# Altium schematic sheet TYPE-C_TO_MIPI-CSI_SHEET.SchDoc
size 420 x 297 mm; SheetNumber: 20; SheetTotal: 23
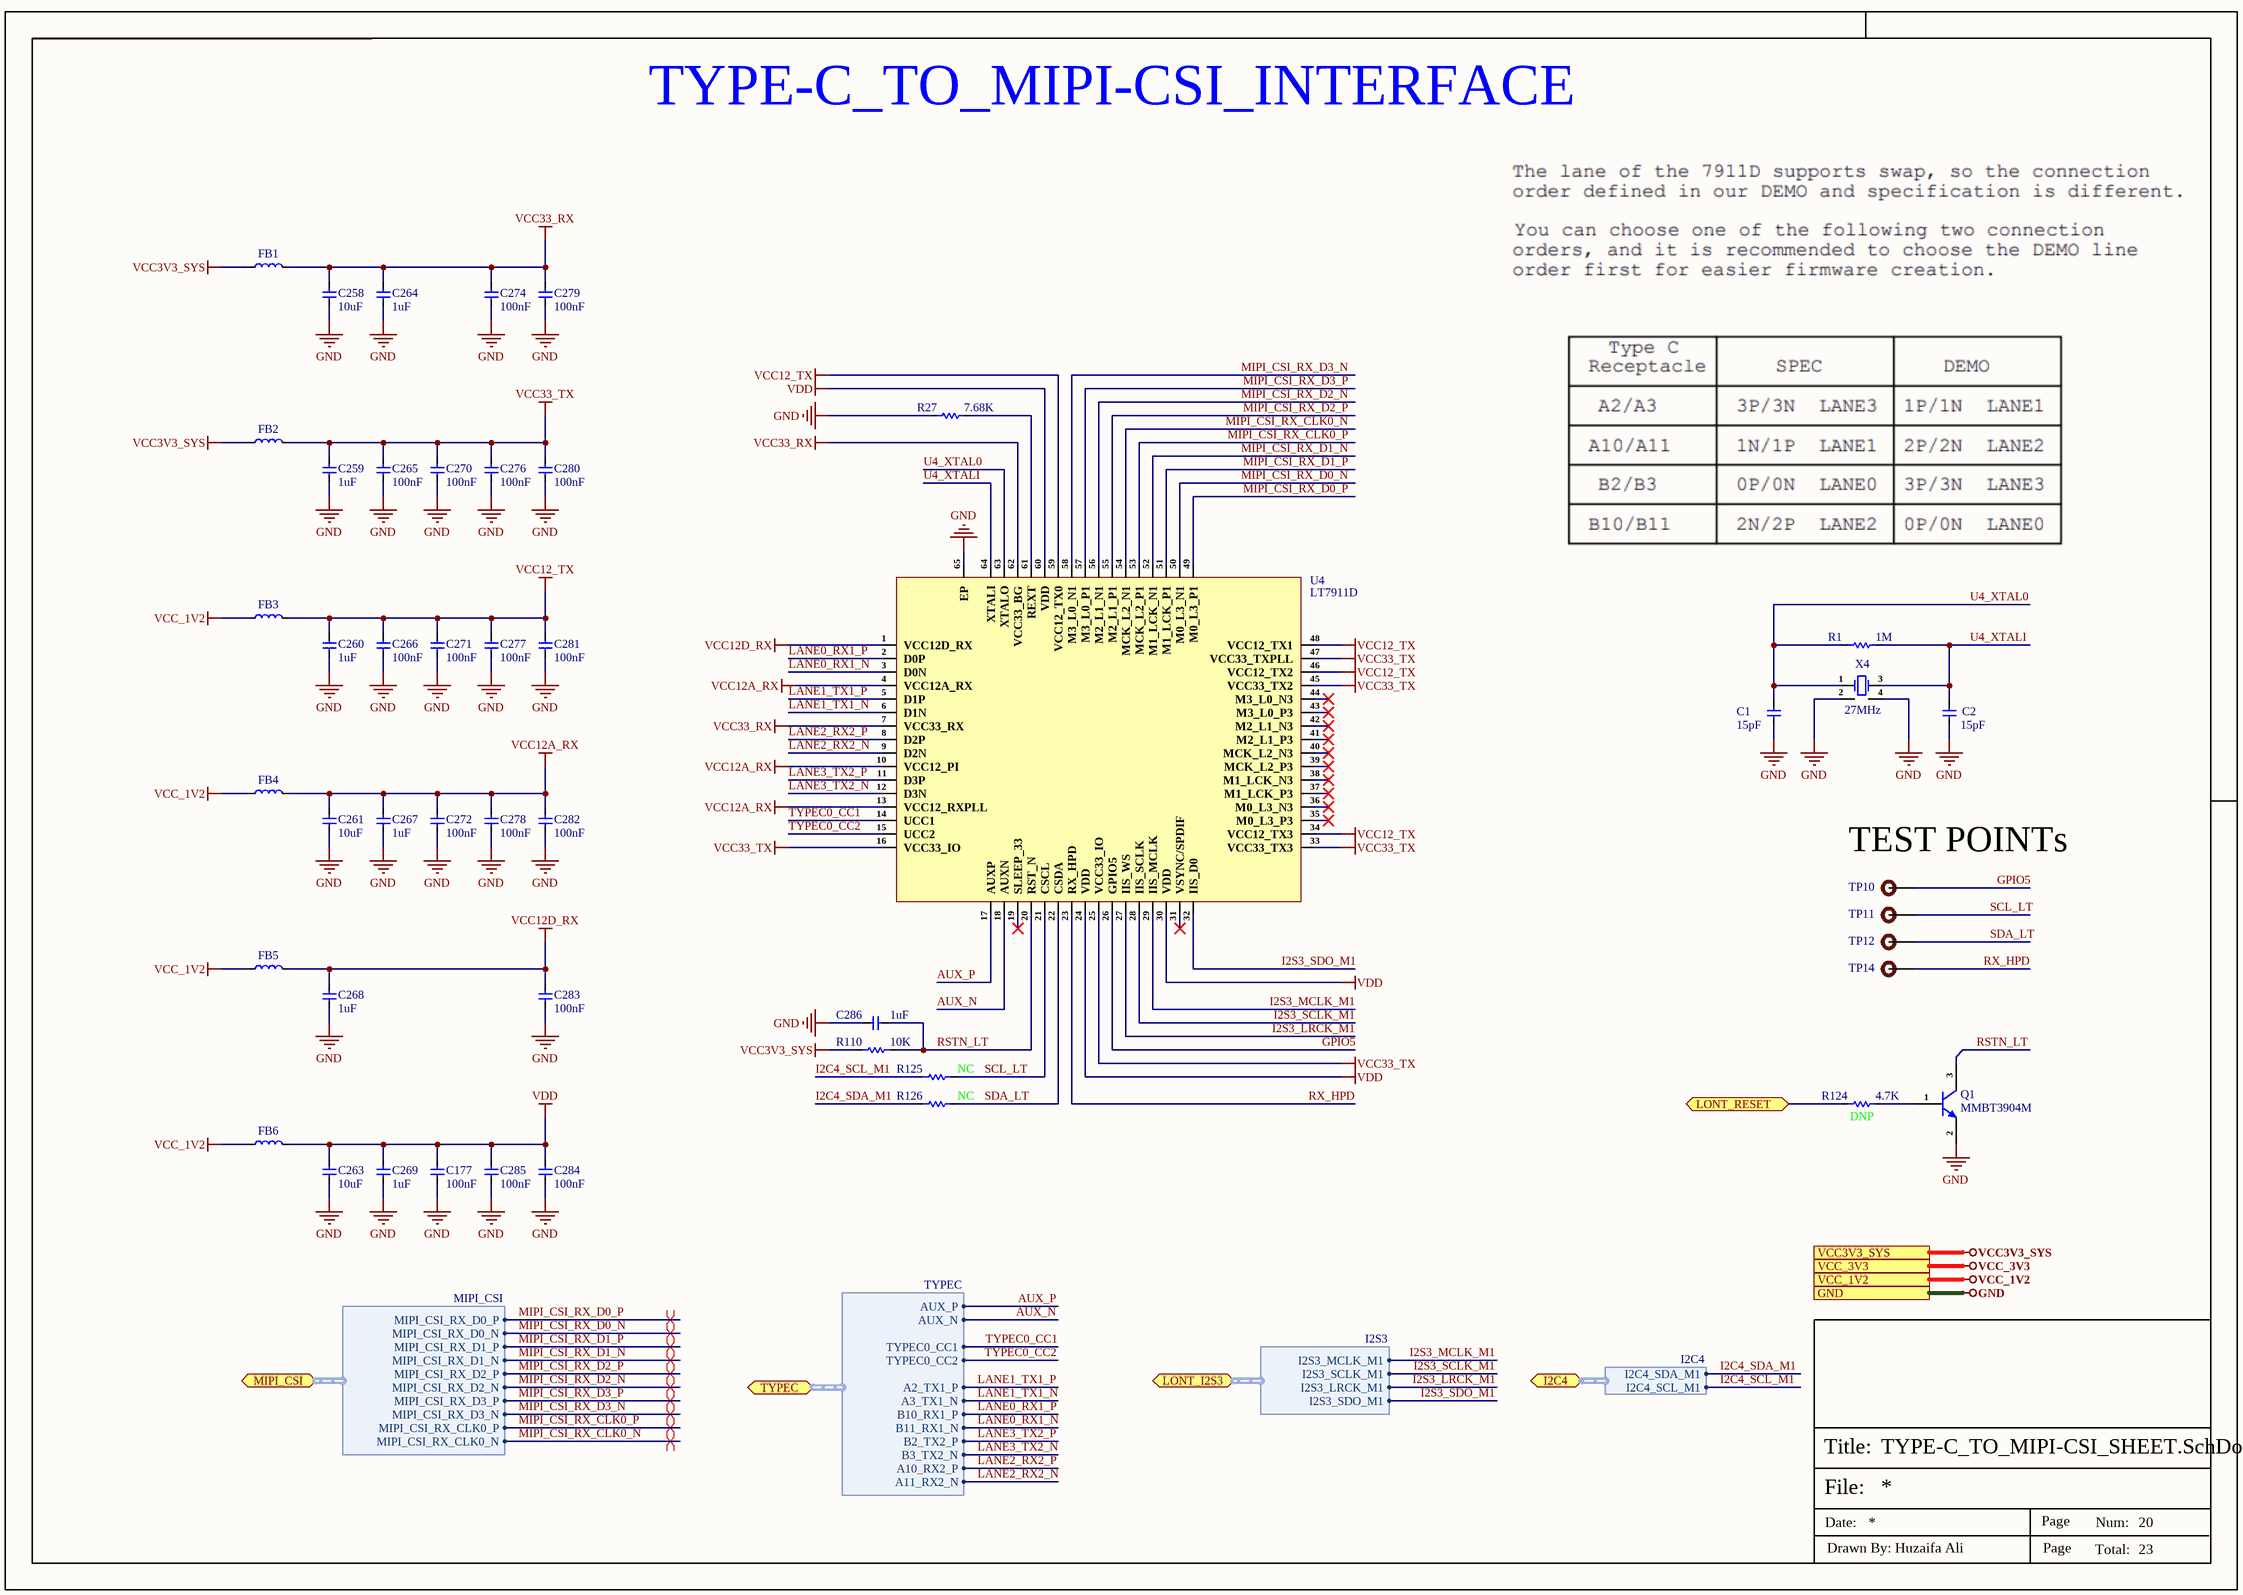
[diagram p0: TYPE-C_TO_MIPI-CSI_SHEET.SchDoc]

## Parts
C1  15pF  [Cap-0402]
C2  15pF  [Cap-0402]
C177  100nF  [CAP-0201]
C258  10uF  [Cap-0402]
C259  1uF  [Cap-0402]
C260  1uF  [Cap-0402]
C261  10uF  [Cap-0402]
C263  10uF  [Cap-0402]
C264  1uF  [Cap-0402]
C265  100nF  [CAP-0201]
C266  100nF  [CAP-0201]
C267  1uF  [Cap-0402]
C268  1uF  [CAP-0201]
C269  1uF  [CAP-0201]
C270  100nF  [CAP-0201]
C271  100nF  [CAP-0201]
C272  100nF  [CAP-0201]
C274  100nF  [CAP-0201]
C276  100nF  [CAP-0201]
C277  100nF  [CAP-0201]
C278  100nF  [CAP-0201]
C279  100nF  [CAP-0201]
C280  100nF  [CAP-0201]
C281  100nF  [CAP-0201]
C282  100nF  [CAP-0201]
C283  100nF  [CAP-0201]
C284  100nF  [CAP-0201]
C285  100nF  [CAP-0201]
C286  1uF  [CAP-0201]
FB1  BLM18SG221TN1D  [IND-0603 (1608 Metric)]  (value not drawn)
FB2  BLM18SG221TN1D  [IND-0603 (1608 Metric)]  (value not drawn)
FB3  BLM18SG221TN1D  [IND-0603 (1608 Metric)]  (value not drawn)
FB4  BLM18SG221TN1D  [IND-0603 (1608 Metric)]  (value not drawn)
FB5  BLM18SG221TN1D  [IND-0603 (1608 Metric)]  (value not drawn)
FB6  BLM18SG221TN1D  [IND-0603 (1608 Metric)]  (value not drawn)
Q1  MMBT3904M  [SOT-723]
R1  1M  [Res-0402]
R27  7.68K  [Res-0402]
R110  10K  [Res-0201]
R124  DNP  [Res-0402]
R125  NC  [Res-0402]
R126  NC  [Res-0402]
TP10  TEST POINT 0.5mm Dia  [Test-point - 0.5mm]  (value not drawn)  (no BOM)
TP11  TEST POINT 0.5mm Dia  [Test-point - 0.5mm]  (value not drawn)  (no BOM)
TP12  TEST POINT 0.5mm Dia  [Test-point - 0.5mm]  (value not drawn)  (no BOM)
TP14  TEST POINT 0.5mm Dia  [Test-point - 0.5mm]  (value not drawn)  (no BOM)
U4  LT7911D  [QFN-64-EP(7.5x7.5)]
X4  27MHz  [SMD2520-4P]

## Ports
GND (see DRAM_LPDDR4_SHEET[6D], eMMC_SPI-FLASH_SHEET[1D], HDMI2.0_SHEET[3D], POWER_LDO_SHEET[3D], POWER_OTHER_SHEET[3C], POWER_PMIC_RK809_CODEC[3C], POWER_PMIC_RK809_DC DC[3D], POWER_PMIC_RK809_LDO[4C], POWER_PMIC_RK809_MGM[3D], RK3566_AUDIO_SHEET[3C], RK3566_DDR-PHY_SHEET[5D], RK3566_FLASH-SD_SHEET[4C], RK3566_OSC_PMUIO_SHEET[5D], RK3566_POWER_SHEET[3D], RK3566_SARADC_GPIO[3D], RK3566_USB_PCIe_SHEET[3D], RK3566_VI_SHEET[3D], RK3566_VO_SHEET_1[3C], RK3566_VO_SHEET_2[4C], TYPE-C_INTERFACE_SHEET[3D], USB2.0_SHEET[3D], WIFI-6_SHEET[3D]), I2C4 (bidir, harness I2C4, see RK3566_VI_SHEET[1D]), LONT_I2S3 (bidir, harness I2S3, see RK3566_AUDIO_SHEET[3B]), LONT_RESET (bidir, see RK3566_VI_SHEET[3B]), MIPI_CSI (bidir, harness MIPI_CSI, see RK3566_VI_SHEET[1D]), TYPEC (bidir, harness TYPEC, see TYPE-C_INTERFACE_SHEET[1D]), VCC3V3_SYS (see DRAM_LPDDR4_SHEET[6D], POWER_LDO_SHEET[3D], POWER_OTHER_SHEET[3C], POWER_PMIC_RK809_DC DC[3D], POWER_PMIC_RK809_LDO[4C], POWER_PMIC_RK809_MGM[3D], RK3566_SARADC_GPIO[3D], WIFI-6_SHEET[3D]), VCC_1V2 (see POWER_OTHER_SHEET[3C]), VCC_3V3 (see eMMC_SPI-FLASH_SHEET[1D], HDMI2.0_SHEET[3D], POWER_PMIC_RK809_LDO[4C], RK3566_AUDIO_SHEET[3C], RK3566_SARADC_GPIO[3D], RK3566_USB_PCIe_SHEET[3D], RK3566_VI_SHEET[3D], RK3566_VO_SHEET_2[4C], WIFI-6_SHEET[3D])

## Harnesses
MIPI_CSI: MIPI_CSI_RX_D0_P, MIPI_CSI_RX_D0_N, MIPI_CSI_RX_D1_P, MIPI_CSI_RX_D1_N, MIPI_CSI_RX_D2_P, MIPI_CSI_RX_D2_N, MIPI_CSI_RX_D3_P, MIPI_CSI_RX_D3_N, MIPI_CSI_RX_CLK0_P, MIPI_CSI_RX_CLK0_N
TYPEC: TYPEC0_CC1, TYPEC0_CC2, AUX_N, AUX_P, A2_TX1_P, A3_TX1_N, B11_RX1_N, B10_RX1_P, B3_TX2_N, B2_TX2_P, A10_RX2_P, A11_RX2_N
I2S3: I2S3_MCLK_M1, I2S3_SCLK_M1, I2S3_LRCK_M1, I2S3_SDO_M1
I2C4: I2C4_SDA_M1, I2C4_SCL_M1

## Nets
GND: C1.1 C2.1 C177.1 C258.1 C259.1 C260.1 C261.1 C263.1 C264.1 C265.1 C266.1 C267.1 C268.1 C269.1 C270.1 C271.1 C272.1 C274.1 C276.1 C277.1 C278.1 C279.1 C280.1 C281.1 C282.1 C283.1 C284.1 C285.1 C286.1 Q1.2(E) R27.2 U4.65(EP) X4.2(GND) X4.4(GND) ; port GND
VCC3V3_SYS: FB1.1 FB2.1 R110.1 ; port VCC3V3_SYS
VCC12_TX: C260.2 C266.2 C271.2 C277.2 C281.2 FB3.2 U4.34(VCC12_TX3) U4.46(VCC12_TX2) U4.48(VCC12_TX1) U4.59(VCC12_TX0)
VCC12A_RX: C261.2 C267.2 C272.2 C278.2 C282.2 FB4.2 U4.4(VCC12A_RX) U4.10(VCC12_PI) U4.13(VCC12_RXPLL)
VCC12D_RX: C268.2 C283.2 FB5.2 U4.1(VCC12D_RX)
VCC33_RX: C258.2 C264.2 C274.2 C279.2 FB1.2 U4.7(VCC33_RX) U4.62(VCC33_BG)
VCC33_TX: C259.2 C265.2 C270.2 C276.2 C280.2 FB2.2 U4.16(VCC33_IO) U4.25(VCC33_IO) U4.33(VCC33_TX3) U4.45(VCC33_TX2) U4.47(VCC33_TXPLL)
VCC_1V2: FB3.1 FB4.1 FB5.1 FB6.1 ; port VCC_1V2
VCC_3V3: port VCC_3V3
VDD: C177.2 C263.2 C269.2 C284.2 C285.2 FB6.2 U4.24(VDD) U4.30(VDD) U4.60(VDD)
AUX_N: U4.18(AUXN) ; port TYPEC.AUX_N
AUX_P: U4.17(AUXP) ; port TYPEC.AUX_P
GPIO5: TP10.1 U4.26(GPIO5)
I2C4_SCL_M1: R125.1 ; port I2C4.I2C4_SCL_M1
I2C4_SDA_M1: R126.1 ; port I2C4.I2C4_SDA_M1
I2S3_LRCK_M1: U4.27(IIS_WS) ; port LONT_I2S3.I2S3_LRCK_M1
I2S3_MCLK_M1: U4.29(IIS_MCLK) ; port LONT_I2S3.I2S3_MCLK_M1
I2S3_SCLK_M1: U4.28(IIS_SCLK) ; port LONT_I2S3.I2S3_SCLK_M1
I2S3_SDO_M1: U4.32(IIS_D0) ; port LONT_I2S3.I2S3_SDO_M1
LANE0_RX1_N: U4.3(D0N) ; port TYPEC.B11_RX1_N
LANE0_RX1_P: U4.2(D0P) ; port TYPEC.B10_RX1_P
LANE1_TX1_N: U4.6(D1N) ; port TYPEC.A3_TX1_N
LANE1_TX1_P: U4.5(D1P) ; port TYPEC.A2_TX1_P
LANE2_RX2_N: U4.9(D2N) ; port TYPEC.A11_RX2_N
LANE2_RX2_P: U4.8(D2P) ; port TYPEC.A10_RX2_P
LANE3_TX2_N: U4.12(D3N) ; port TYPEC.B3_TX2_N
LANE3_TX2_P: U4.11(D3P) ; port TYPEC.B2_TX2_P
LONT_RESET: R124.1 ; port LONT_RESET
MIPI_CSI_RX_CLK0_N: U4.54(MCK_L2_N1) ; port MIPI_CSI.MIPI_CSI_RX_CLK0_N
MIPI_CSI_RX_CLK0_P: U4.53(MCK_L2_P1) ; port MIPI_CSI.MIPI_CSI_RX_CLK0_P
MIPI_CSI_RX_D0_N: U4.50(M0_L3_N1) ; port MIPI_CSI.MIPI_CSI_RX_D0_N
MIPI_CSI_RX_D0_P: U4.49(M0_L3_P1) ; port MIPI_CSI.MIPI_CSI_RX_D0_P
MIPI_CSI_RX_D1_N: U4.52(M1_LCK_N1) ; port MIPI_CSI.MIPI_CSI_RX_D1_N
MIPI_CSI_RX_D1_P: U4.51(M1_LCK_P1) ; port MIPI_CSI.MIPI_CSI_RX_D1_P
MIPI_CSI_RX_D2_N: U4.56(M2_L1_N1) ; port MIPI_CSI.MIPI_CSI_RX_D2_N
MIPI_CSI_RX_D2_P: U4.55(M2_L1_P1) ; port MIPI_CSI.MIPI_CSI_RX_D2_P
MIPI_CSI_RX_D3_N: U4.58(M3_L0_N1) ; port MIPI_CSI.MIPI_CSI_RX_D3_N
MIPI_CSI_RX_D3_P: U4.57(M3_L0_P1) ; port MIPI_CSI.MIPI_CSI_RX_D3_P
RSTN_LT: C286.2 Q1.3(C) R110.2 U4.20(RST_N)
RX_HPD: TP14.1 U4.23(RX_HPD)
SCL_LT: R125.2 TP11.1 U4.21(CSCL)
SDA_LT: R126.2 TP12.1 U4.22(CSDA)
TYPEC0_CC1: U4.14(UCC1) ; port TYPEC.TYPEC0_CC1
TYPEC0_CC2: U4.15(UCC2) ; port TYPEC.TYPEC0_CC2
U4_XTAL0: C1.2 R1.1 U4.63(XTALO) X4.1(OSC1)
U4_XTALI: C2.2 R1.2 U4.64(XTALI) X4.3(OSC2)
NetQ1_1: Q1.1(B) R124.2
NetR27_1: R27.1 U4.61(REXT)

Not connected (* = marked no-connect by the designer): U4 19(SLEEP_33)* 31(VSYNC/SPDIF)* 35(M0_L3_P3)* 36(M0_L3_N3)* 37(M1_LCK_P3)* 38(M1_LCK_N3)* 39(MCK_L2_P3)* 40(MCK_L2_N3)* 41(M2_L1_P3)* 42(M2_L1_N3)* 43(M3_L0_P3)* 44(M3_L0_N3)*

## Layout directives
differential pair; differential pair class MIPI_LINES_100; rule Matched Net Lengths [Tolerance = 0.508mm]; rule Impedance Constraint [Min = 98.00    Max = 102.0    ]: MIPI_CSI_RX_CLK0_N, MIPI_CSI_RX_CLK0_P, MIPI_CSI_RX_D0_N, MIPI_CSI_RX_D0_P, MIPI_CSI_RX_D1_N, MIPI_CSI_RX_D1_P, MIPI_CSI_RX_D2_N, MIPI_CSI_RX_D2_P, MIPI_CSI_RX_D3_N, MIPI_CSI_RX_D3_P

## Notes on the sheet
- TYPE-C_TO_MIPI-CSI_INTERFACE
- (near TP10) TEST POINTs
- (near R124) 4.7K
- File:
- Title:
- Date:
- Page
- Num:
- Total:
- Drawn By: Huzaifa Ali

## Library data of the parts
C1 C2 = CQ0402GRNPO9BN150: CAP CER 15PF 50V C0G/NPO 0402; Manufacturer: Yageo; Tolerance: 2%; Dielectric: C0G; Item Type: Capacitors; Manufacturer Part Number: CQ0402GRNPO9BN150; RoHS: Yes; Mounting Technology: Surface Mount; Case/Package: 0402; Case Code (Metric): 1005; Case Code (Imperial): 0402; Min Operating Temperature: -55°C; Max Operating Temperature: 125°C; Value: 15pF; Series: CQ; Packaging: Tape and Reel; Package Quantity: 10000; Voltage Rating: 50V; ComponentLink1URL: http://www.mouser.com/ds/2/447/UPY-High%20Q_NP0_16V-to-250V_11-533944.pdf?src-supplier=Mouser; ComponentLink1Description: http://www.mouser.com/ds/2/447/UPY-High%20Q_NP0_16V-to-250V_11-533944.pdf?src-supplier=Mouser; ComponentLink2URL: http://www.yageo.com/documents/recent/UPY-High%20Q_NP0_16V-to-250V_13.pdf?src-supplier=Digikey; ComponentLink2Description: http://www.yageo.com/documents/recent/UPY-High%20Q_NP0_16V-to-250V_13.pdf?src-supplier=Digikey; LCSC Part Number: C577406; Supplier: Digikey; Pricing: 10000=0.04366 (USD); Weight: 2.3E-05oz; Voltage Rating (DC): 50V
C177 C265 C266 C270-C272 C274 C276-C285 = CC0201KRX5R6BB104: CAP CER 0.1UF 10V X5R 0201; Manufacturer: Yageo; Tolerance: 10%; Supplier 1: Mouser; Manufacturer Part Number: CC0201KRX5R6BB104; RoHS: Yes; Category: Ceramic Capacitors; Stock 1: 824403; Pricing 1: 1=0.10000, 10=0.02400, 50=0.02400, 100=0.01900, 1000=0.01100, 10000=0.00900 (USD); Mount: Surface Mount; Case/Package: 0201; Case Code (Imperial): 0201; Case Code (Metric): 0603; Weight: 6E-06oz; Min Operating Temperature: -55°C; Max Operating Temperature: 85°C; Capacitance: 100nF; Dielectric: X5R; Voltage Rating (DC): 10V; Packaging: Tape and Reel; Termination: SMD/SMT; Resistor Type: Ceramic; Voltage Rating: 10V; Series: CC; Construction: Flat; Length: 0.6mm; Width: 0.012inch; Height: 0.3mm; Thickness: 0.013inch; Depth: 0.3mm; Radiation Hardening: No; Lead Free: Lead Free; Halogen Free: Halogen Free; RoHS Compliant: Yes; ComponentLink1URL: https://datasheet.ciiva.com/11587/upy-gphc-x5r-4v-to-50v-12-11587190.pdf?src-supplier=Avnet; ComponentLink1Description: https://datasheet.ciiva.com/11587/upy-gphc-x5r-4v-to-50v-12-11587190.pdf?src-supplier=Avnet; Supplier Part Number 1: 603-CC201KRX5R6BB104; LCSC Part Number: C190183
C258 C261 C263 = CL05A106MP5NUNC: CAP CER 10UF 10V X5R 0402; Manufacturer: Samsung; Tolerance: 20%; Item Type: Capacitor; Supplier 1: Avnet; Manufacturer Part Number: CL05A106MP5NUNC; RoHS: Yes; Category: Ceramic Capacitors; Stock 1: 1729850; Pricing 1: 10000=0.02537 (USD); Mount: Surface Mount; Case/Package: 0402; Case Code (Metric): 1005; Case Code (Imperial): 0402; Min Operating Temperature: -55°C; Max Operating Temperature: 85°C; Capacitance: 10uF; Dielectric: X5R; Packaging: Tape and Reel; Package Quantity: 1; Voltage Rating: 10V; Termination: Wraparound; Series: CL; Length: 1mm; Width: 0.02inch; Thickness: 0.028inch; Depth: 0.5mm; Radiation Hardening: No; Lead Free: Lead Free; RoHS Compliant: Yes; ComponentLink1URL: https://datasheet.ciiva.com/25721/cl05a106mp5nunc-25721584.pdf?src-supplier=Digi-Key; ComponentLink1Description: https://datasheet.ciiva.com/25721/cl05a106mp5nunc-25721584.pdf?src-supplier=Digi-Key; ComponentLink2URL: https://datasheet.ciiva.com/26838/getdatasheetpartid-745310-26838170.pdf?src-supplier=Verical; ComponentLink2Description: https://datasheet.ciiva.com/26838/getdatasheetpartid-745310-26838170.pdf?src-supplier=Verical; Supplier Part Number 1: CL05A106MP5NUNC; LCSC Part Number: C315248; Contact Plating: Tin; Construction: Flat
C259 C260 C264 C267 = CC0402KRX5R6BB105: CAP CER 1UF 10V X5R 0402; Manufacturer: Yageo; Tolerance: 10%; Dissipation Factor: 15%; Item Type: Capacitor; Supplier 1: Mouser; Manufacturer Part Number: CC0402KRX5R6BB105; RoHS: Yes; Category: Ceramic Capacitors; Stock 1: 6711367; Pricing 1: 1=0.11000, 10=0.05500, 50=0.05500, 100=0.03300, 500=0.02700, 1000=0.02200, 2500=0.02100, 10000=0.01800 (USD); Mount: Surface Mount; Case/Package: 0402; Number of Pins: 2; Case Code (Metric): 1005; Case Code (Imperial): 0402; Min Operating Temperature: -55°C; Max Operating Temperature: 85°C; Capacitance: 1uF; Dielectric: X5R; Package Quantity: 1; Voltage Rating: 10V; Packaging: Tape and Reel; Voltage Rating (DC): 10V; Termination: SMD/SMT; Resistor Type: Ceramic; Series: CC; Construction: Flat; Length: 1mm; Width: 0.02inch; Height: 0.5mm; Thickness: 0.022inch; Depth: 0.5mm; Radiation Hardening: No; REACH SVHC: No SVHC; Lead Free: Lead Free; Halogen Free: Halogen Free; RoHS Compliant: Yes; ComponentLink1URL: https://datasheet.ciiva.com/176/upy-gphc-x5r-4v-to-50v-12-176704.pdf?src-supplier=Digi-Key; ComponentLink1Description: https://datasheet.ciiva.com/176/upy-gphc-x5r-4v-to-50v-12-176704.pdf?src-supplier=Digi-Key; ComponentLink2URL: https://datasheet.ciiva.com/176/mlccorderingcode-176705.pdf?src-supplier=Digi-Key; ComponentLink2Description: https://datasheet.ciiva.com/176/mlccorderingcode-176705.pdf?src-supplier=Digi-Key; ComponentLink3URL: https://datasheet.ciiva.com/176/mlccorderingcode-176706.pdf?src-supplier=Digi-Key; ComponentLink3Description: https://datasheet.ciiva.com/176/mlccorderingcode-176706.pdf?src-supplier=Digi-Key; Supplier Part Number 1: 603-CC402KRX5R6BB105; LCSC Part Number: C106254
C268 C269 C286 = CC0201MRX5R6BB105: CAP CER 1UF 10V X5R 0201; Manufacturer: Yageo; Item Type: Capacitor; Manufacturer Part Number: CC0201MRX5R6BB105; RoHS: Yes; Category: Ceramic Capacitors; ComponentLink1URL: https://datasheet.octopart.com/CC0201MRX5R6BB105-Yageo-datasheet-158238148.pdf?src-supplier=Farnell; ComponentLink1Description: https://datasheet.octopart.com/CC0201MRX5R6BB105-Yageo-datasheet-158238148.pdf?src-supplier=Farnell; ComponentLink2URL: http://www.yageo.com/documents/recent/UPY-GPHC_X5R_4V-to-50V_25.pdf?src-supplier=Digi-Key; ComponentLink2Description: http://www.yageo.com/documents/recent/UPY-GPHC_X5R_4V-to-50V_25.pdf?src-supplier=Digi-Key; ComponentLink3URL: https://datasheet.octopart.com/CC0201MRX5R6BB105-Yageo-datasheet-137700082.pdf?src-supplier=Future+Electronics; ComponentLink3Description: https://datasheet.octopart.com/CC0201MRX5R6BB105-Yageo-datasheet-137700082.pdf?src-supplier=Future+Electronics; LCSC Part Number: C605210; Supplier: Digi-Key; Supplier Part Number: 311-3474-1-ND; Stock: 772400; Pricing: 1=0.19, 10=0.135, 50=0.0764, 100=0.0633, 500=0.04436, 1000=0.03672, 2500=0.03418, 5000=0.03127 (USD)
FB1-FB6 = BLM18SG221TN1D: FERRITE BEAD 220 OHM 0603 1LN; Manufacturer: Murata; Current Rating: 2.5A; Tolerance: 25%; Impedance: 220R; DC Resistance (DCR): 40mR; Test Frequency: 100MHz; Number of Lines: 1; Item Type: Ferrite Beads; Material: Steel,Ferrite; Supplier: Future Electronics; Manufacturer Part Number: BLM18SG221TN1D; RoHS: Yes; Stock: 60000; Pricing: 10000=0.0299, 20000=0.0294, 30000=0.0292, 40000=0.029, 50000=0.0284 (USD); Case/Package: 0603; Pins: 2; Case Code (Imperial): 0603; Core Material: Ferrite; Case Code (Metric): 1608; Packaging: Tape and Reel; Package Quantity: 1; Max DC Current: 2.5A; Series: BLM18S; Max Current Rating: 2.5A; RMS Current (Irms): 2.5A; ESR: 40mR; Length: 1.6mm; Width: 0.8mm; Height: 0.8mm; Lead Free: Lead Free; RoHS Compliant: Yes; Reach SVHC Compliant: No; ComponentLink1URL: https://datasheet.ciiva.com/1561/c31e-1561456.pdf?src-supplier=Newark; ComponentLink1Description: https://datasheet.ciiva.com/1561/c31e-1561456.pdf?src-supplier=Newark; ComponentLink2URL: https://datasheet.ciiva.com/41449/001171724-da-01-en-chip-drossel0603-220r-2500ma-1-6x0-8mm-41449352.pdf?src-supplier=Conrad; ComponentLink2Description: https://datasheet.ciiva.com/41449/001171724-da-01-en-chip-drossel0603-220r-2500ma-1-6x0-8mm-41449352.pdf?src-supplier=Conrad; ComponentLink3URL: https://datasheet.ciiva.com/41449/001172313-da-01-en-drossel-0603-220r-21-6x0-8mm-10000st-41449677.pdf?src-supplier=Conrad; ComponentLink3Description: https://datasheet.ciiva.com/41449/001172313-da-01-en-drossel-0603-220r-21-6x0-8mm-10000st-41449677.pdf?src-supplier=Conrad; ComponentLink4URL: https://datasheet.ciiva.com/14122/blm-series-eng-tds-14122910.pdf?src-supplier=Distrelec; ComponentLink4Description: https://datasheet.ciiva.com/14122/blm-series-eng-tds-14122910.pdf?src-supplier=Distrelec; LCSC Part Number: C88988; Weight: 7.1E-05oz; Min Operating Temperature: -55°C; Max Operating Temperature: 125°C; Termination: SMD/SMT; DC Current: 2.5A; Number of Circuits: 1; DC Resistance-Max: 40mR; Depth: 0.95mm; Radiation Hardening: No; ComponentLink5URL: https://datasheet.ciiva.com/8508/l0110s0100blm18s-8508310.pdf?src-supplier=Avnet; ComponentLink5Description: https://datasheet.ciiva.com/8508/l0110s0100blm18s-8508310.pdf?src-supplier=Avnet; ComponentLink6URL: https://datasheet.ciiva.com/8021/5151-8021517.pdf?src-supplier=Element14; ComponentLink6Description: https://datasheet.ciiva.com/8021/5151-8021517.pdf?src-supplier=Element14; ComponentLink7URL: https://datasheet.ciiva.com/8021/5151-8021519.pdf?src-supplier=Element14; ComponentLink7Description: https://datasheet.ciiva.com/8021/5151-8021519.pdf?src-supplier=Element14; ComponentLink8URL: https://datasheet.ciiva.com/1012/l0110s0100blm18s-1012627.pdf?src-supplier=Digikey; ComponentLink8Description: https://datasheet.ciiva.com/1012/l0110s0100blm18s-1012627.pdf?src-supplier=Digikey; ComponentLink9URL: https://datasheet.ciiva.com/1012/l0110s0100blm18s-1012626.pdf?src-supplier=Digikey; ComponentLink9Description: https://datasheet.ciiva.com/1012/l0110s0100blm18s-1012626.pdf?src-supplier=Digikey; ComponentLink10URL: https://datasheet.ciiva.com/1012/l0110s0100blm18s-1012628.pdf?src-supplier=Digikey; ComponentLink10Description: https://datasheet.ciiva.com/1012/l0110s0100blm18s-1012628.pdf?src-supplier=Digikey; ComponentLink11URL: https://datasheet.ciiva.com/16204/l0110s0100blm18s-16204029.pdf?src-supplier=Future+Electronics; ComponentLink11Description: https://datasheet.ciiva.com/16204/l0110s0100blm18s-16204029.pdf?src-supplier=Future+Electronics
Q1 = MMBT3904M: 40V 100mW 100@10mA,1V 200mA 300MHz 300mV@50mA,5mA NPN -55℃~+150℃@(Tj) SOT-723 Bipolar Transistors - BJT ROHS; Manufacturer: TECH PUBLIC; Item Type: Mosfet; ComponentLink1Description: LCSC; ComponentLink1URL: https://www.lcsc.com/product-detail/Bipolar-Transistors-BJT_TECH-PUBLIC-MMBT3904M_C2923360.html; Manufacturer Part Number: MMBT3904M; Package: SOT-723; LCSC Part Number: C2923360
R1 = RC0402FR-071ML: RES 1M OHM 1% 1/16W 0402; Manufacturer: Yageo; Value: 1MR; Power Rating: 63mW; Voltage Rating: 50V; Temperature Coefficient: 100ppm/°C; Item Type: Resistor; Supplier: Digikey; Supplier Part Number: 311-1.00MLRCT-ND; Manufacturer Part Number: RC0402FR-071ML; RoHS: Yes; Category: Chip SMD Resistors; Stock: 6516; Pricing: 1=0.1, 10=0.015, 50=0.0088, 100=0.0073, 500=0.00488, 1000=0.00417, 5000=0.00297 (USD); Case/Package: 0402; Case Code (Imperial): 0402; Case Code (Metric): 1005; Min Operating Temperature: -55°C; Max Operating Temperature: 155°C; Resistor Type: Thick Film; Packaging: Tape and Reel; Tolerance: 1%; Termination: SMD/SMT; Features: Moisture Resistant; Series: RC; Max Power Dissipation: 63mW; Number of Terminations: 2; Resistance Tolerance: 1%; Construction: Rectangular; Technology: THICK FILM; Voltage Rating (AC): 50V; Length: 1mm; Height: 0.32mm; Depth: 0.5mm; RoHS Compliant: Yes; Military Standard: Not; Reach SVHC Compliant: Unknown; Lead Free: 5697LeadFree; ComponentLink1URL: https://datasheet.ciiva.com/11808/0900766b80c66297-11808125.pdf?src-supplier=Rs; ComponentLink1Description: https://datasheet.ciiva.com/11808/0900766b80c66297-11808125.pdf?src-supplier=Rs; ComponentLink2URL: https://datasheet.ciiva.com/46394/1018594-46394951.pdf?src-supplier=Element14; ComponentLink2Description: https://datasheet.ciiva.com/46394/1018594-46394951.pdf?src-supplier=Element14; ComponentLink3URL: https://datasheet.ciiva.com/7849/1018594-7849883.pdf?src-supplier=Element14; ComponentLink3Description: https://datasheet.ciiva.com/7849/1018594-7849883.pdf?src-supplier=Element14; ComponentLink4URL: https://datasheet.ciiva.com/7849/1018594-7849882.pdf?src-supplier=Element14; ComponentLink4Description: https://datasheet.ciiva.com/7849/1018594-7849882.pdf?src-supplier=Element14; ComponentLink5URL: https://datasheet.ciiva.com/16741/pyu-rc0402-51-rohs-l-6-r-16741081.pdf?src-supplier=Future+Electronics; ComponentLink5Description: https://datasheet.ciiva.com/16741/pyu-rc0402-51-rohs-l-6-r-16741081.pdf?src-supplier=Future+Electronics; LCSC Part Number: C138033
R27 = RT0402BRD077K68L: RES SMD 7.68KOHM 0.1% 1/16W 0402; Manufacturer: Yageo; Item Type: Resistors; Supplier: Mouser; LCSC Part Number: C852919; Manufacturer Part Number: RT0402BRD077K68L; RoHS: Yes; Stock: 6579; Pricing: 1=0.16, 10=0.121, 50=0.096, 100=0.086, 1000=0.061, 10000=0.038 (USD); ComponentLink1URL: https://datasheet.ciiva.com/12724/pyu-rt-1-to-0-05-rohs-l-4-12724831.pdf?src-supplier=Mouser; ComponentLink1Description: https://datasheet.ciiva.com/12724/pyu-rt-1-to-0-05-rohs-l-4-12724831.pdf?src-supplier=Mouser
R110 = RC0201FR-0710KL: RES SMD 10K OHM 1% 1/20W 0201; Manufacturer: Yageo; Item Type: Resistor; Manufacturer Part Number: RC0201FR-0710KL; ComponentLink7URL: https://www.lcsc.com/product-detail/Chip-Resistor-Surface-Mount_YAGEO-RC0201FR-0710KL_C106225.html; ComponentLink7Description: LCSC; LCSC Part Number: C106225; Package: 0201
R124 = RC0402FR-074K7L: RES 4.7K OHM 1% 1/16W 0402; Manufacturer: Yageo; Voltage Rating (DC): 50V; Power Rating: 62.5mW; Resistance: 4.7kR; Temperature Coefficient: 100ppm/°C; Max Power Dissipation: 63mW; Item Type: Resistor; Supplier 1: Avnet; Manufacturer Part Number: RC0402FR-074K7L; RoHS: Yes; Category: Chip SMD Resistors; Stock 1: 2420000; Pricing 1: 10000=0.00085 (USD); Case/Package: 0402; Number of Pins: 2; Case Code (Imperial): 0402; Case Code (Metric): 1005; Size Code: 0402; Min Operating Temperature: -55°C; Max Operating Temperature: 155°C; Tolerance: 1%; Voltage Rating: 50V; Packaging: Tape and Reel; Resistor Type: Thick Film; Termination: SMD/SMT; Features: Moisture Resistant; Series: RC; Number of Terminations: 2; Resistance Tolerance: 1%; Construction: Rectangular; Length: 1mm; Width: 0.5mm; Height: 0.32mm; Depth: 0.5mm; Height - Seated (Max): 0.016inch; RoHS Compliant: Yes; Reach SVHC Compliant: Yes; Military Standard: Not; Lead Free: Lead Free; ComponentLink1URL: https://datasheet.ciiva.com/22661/1686128-22661342.pdf?src-supplier=Element14; ComponentLink1Description: https://datasheet.ciiva.com/22661/1686128-22661342.pdf?src-supplier=Element14; ComponentLink2URL: https://datasheet.ciiva.com/7850/1018594-7850022.pdf?src-supplier=Element14; ComponentLink2Description: https://datasheet.ciiva.com/7850/1018594-7850022.pdf?src-supplier=Element14; ComponentLink3URL: https://datasheet.ciiva.com/7850/1018594-7850023.pdf?src-supplier=Element14; ComponentLink3Description: https://datasheet.ciiva.com/7850/1018594-7850023.pdf?src-supplier=Element14; ComponentLink4URL: https://datasheet.ciiva.com/15215/getdatasheetpartid-328119-15215035.pdf?src-supplier=Verical; ComponentLink4Description: https://datasheet.ciiva.com/15215/getdatasheetpartid-328119-15215035.pdf?src-supplier=Verical; Supplier Part Number 1: RC0402FR-074K7L; LCSC Part Number: C105871
R125 R126 = RC0402FR-070RL: RES 0 OHM JUMPER 1/16W 0402; Manufacturer: Yageo; Item Type: Resistors; Resistance: 0R; Tolerance: 1%; Power Rating: 62.5mW; Voltage Rating: 50V; Temperature Coefficient: 200ppm/°C; Max Power Dissipation: 63mW; Supplier 1: Mouser; Manufacturer Part Number: RC0402FR-070RL; RoHS: Yes; Stock 1: 8556842; Pricing 1: 1=0.10000, 10=0.01400, 50=0.01400, 100=0.00600, 1000=0.00300, 5000=0.00200, 10000=0.00100 (USD); Mount: Surface Mount; Case/Package: 0402; Contact Plating: Tin,Matte; Case Code (Imperial): 0402; Case Code (Metric): 1005; Size Code: 0402; Min Operating Temperature: -55°C; Max Operating Temperature: 155°C; Resistor Type: Thick Film; Packaging: Tape and Reel; Termination: SMD/SMT; Features: Moisture Resistant; Series: RC; Number of Terminations: 2; Length: 1mm; Width: 0.5mm; Height: 0.35mm; Radiation Hardening: No; Lead Free: Lead Free; RoHS Compliant: Yes; ComponentLink1URL: https://datasheet.ciiva.com/8896/pyu-rc0402-51-rohs-l-6-8896149.pdf?src-supplier=Avnet; ComponentLink1Description: https://datasheet.ciiva.com/8896/pyu-rc0402-51-rohs-l-6-8896149.pdf?src-supplier=Avnet; ComponentLink2URL: https://datasheet.ciiva.com/16790/pyu-rc0402-51-rohs-l-6-r-16790444.pdf?src-supplier=Future+Electronics; ComponentLink2Description: https://datasheet.ciiva.com/16790/pyu-rc0402-51-rohs-l-6-r-16790444.pdf?src-supplier=Future+Electronics; Supplier Part Number 1: 603-RC0402FR-070RL; LCSC Part Number: C106231
TP10-TP12 TP14 = TEST POINT 0.5mm Dia: Test Point ON; Item Type: Test Point; Manufacturer Part Number: TEST POINT 0.5mm Dia
U4 = LT7911D: 5.4Gbps Type-C/DP/eDPToDual-port MIPI DSI/CSI/LVDS with Audio QFN-64(7.5x7.5) Video Interface ICs ROHS; Manufacturer: LONTIUM SEMICONDUCTOR; Item Type: IC; Manufacturer Part Number: LT7911D; Package: QFN-64(7.5x7.5); LCSC Part Number: C5310990; ComponentLink1Description: LCSC; ComponentLink1URL: https://jlcpcb.com/partdetail/LontiumSemiconductor-LT7911D/C5310990
X4 = NX2520SA-27MHZ-STD-CSW-5: SMD2520-4P Crystals ROHS; Manufacturer: NDK; Frequency: 32.768kHz; Frequency Tolerance: 20ppm; Load Capacitance: 6pF; ESR (Equivalent Series Resistance): 70kR; Supplier 1: Rs; Manufacturer Part Number: NX2520SA-27MHZ-STD-CSW-5; RoHS: Yes; Category: Crystals; Stock 1: 500; Pricing 1: 5=0.15520, 50=0.68600, 100=0.66600, 250=0.65000, 500=0.63400 (GBP); Mounting Technology: Surface Mount; Case/Package: SMD/SMT; Min Operating Temperature: -40°C; Max Operating Temperature: 85°C; Packaging: Cut Tape; Series: NX3215SA; RoHS Compliant: Yes; Supplier Part Number 1: 1847854; LCSC Part Number: C910047; Item Type: Crystal